# EAGLE design c64-tx (EAGLE 7.7.0)
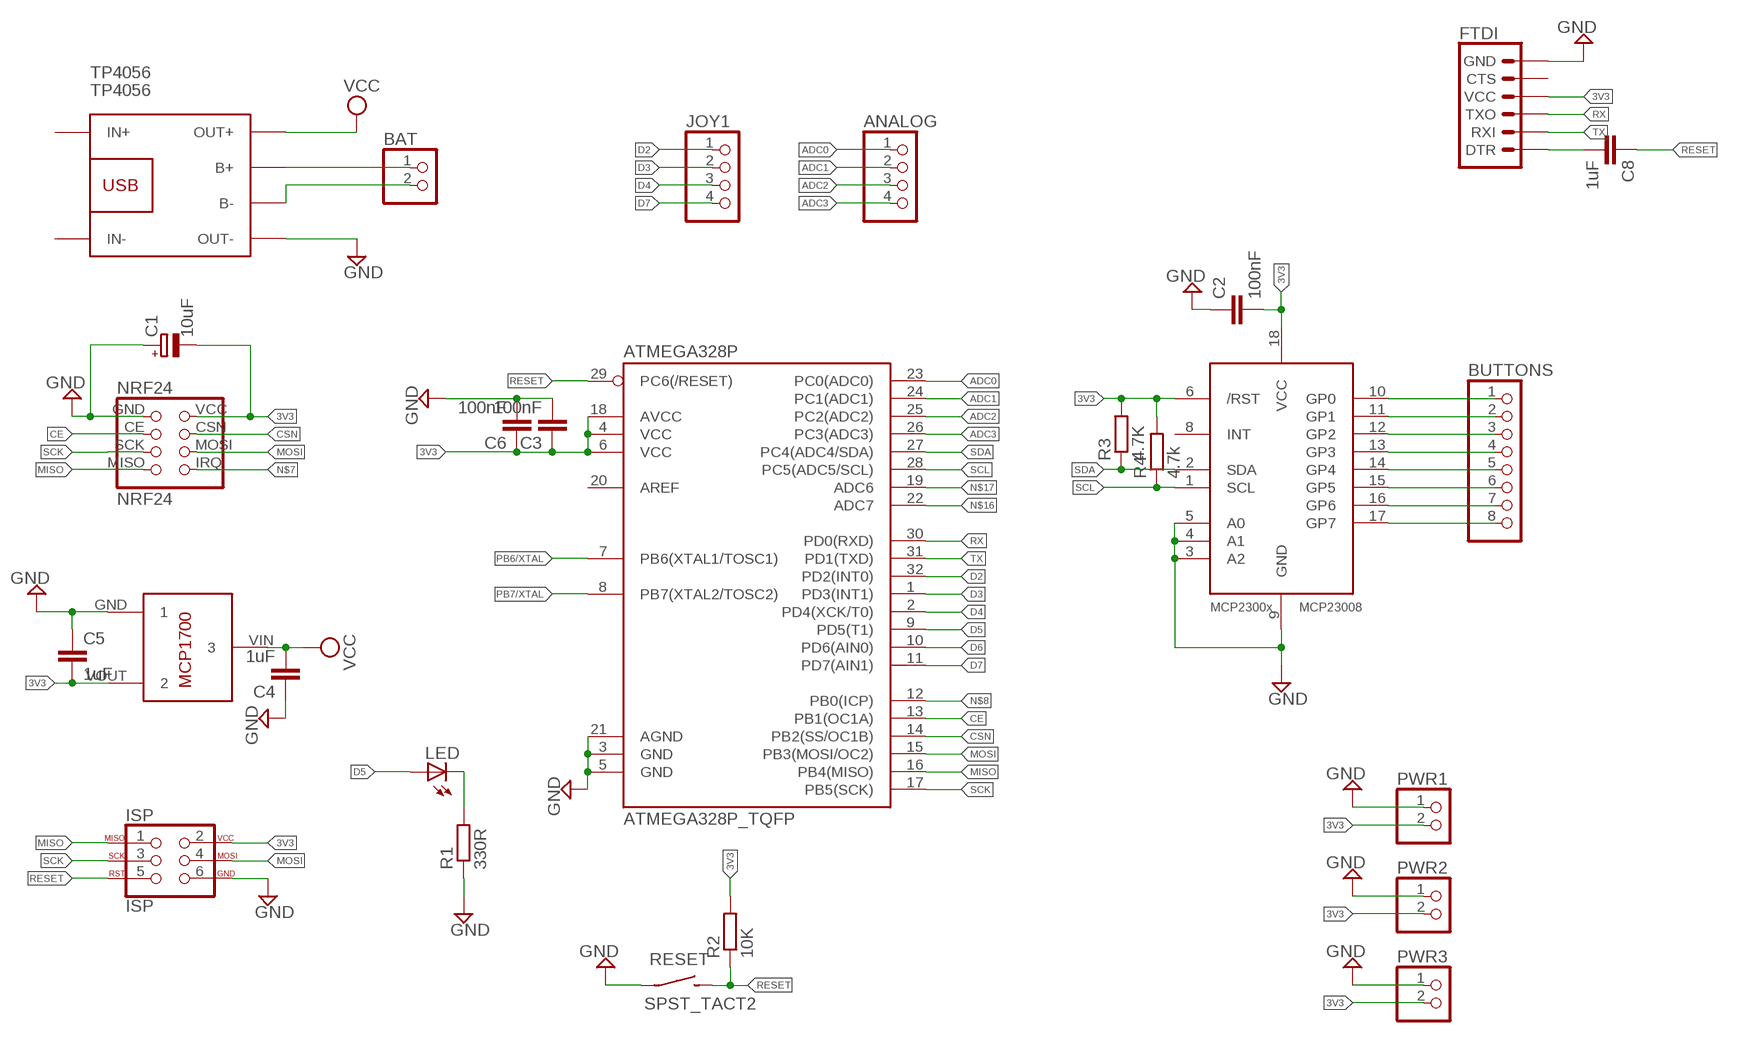
[diagram p0: schematic, sheet 1]

## Parts
ANALOG  PINHD-1X4  [1X04]
ATMEGA328P  ATMEGA328P_TQFP  [TQFP32-08]
BAT  PINHD-1X2  [1X02]
BUTTONS  PINHD-1X8  [1X08]
C1  10uF  CPOL-EUA/3216-18W  [A/3216-18W]
C2  100nF  C-EUC1206K  [C1206K]
C3  100nF  C-EUC1206K  [C1206K]
C4  1uF  C-EUC1206K  [C1206K]
C5  1uF  C-EUC1206K  [C1206K]
C6  100nF  C-EUC1206K  [C1206K]
C8  1uF  C-EUC1206K  [C1206K]
FTDI  6_PIN_SERIAL_TARGETPTH-KIT  [1X06-KIT]
ISP  ISP  AVR_SPI_PROG_3X2NS  [2X3-NS]
JOY1  PINHD-1X4  [1X04]
LED  LEDSMT1206  [1206]
MCP1700  MCP1700T-3302E/TT  [MCP1700T-3302E/TT]
MCP23008  MCP23008/SO  [SO18W]
NRF24  NRF24  NRF24PCBPAD  [NRF24-PCB]
PWR1  PINHD-1X2  [1X02]
PWR2  PINHD-1X2  [1X02]
PWR3  PINHD-1X2  [1X02]
R1  330R  R-EU_M1206  [M1206]
R2  10K  R-EU_M1206  [M1206]
R3  4.7K  R-EU_M1206  [M1206]
R4  4.7k  R-EU_M1206  [M1206]
RESET  SPST_TACT2  [6MMTACTILE]
TP4056  TP4056  BATTERY-CHARGER-LI-PROT  [BATTERY-CHARGER-LI-PROT]

## Nets
3V3 [POWER]: ATMEGA328P.4(VCC) ATMEGA328P.6(VCC) ATMEGA328P.18(AVCC) C1.- C2.2 C3.1 C5.2 C6.1 FTDI.4(VCC) ISP.2 MCP1700.VOUT MCP23008.6(/RST) MCP23008.18(VCC) NRF24.VCC PWR1.2 PWR2.2 PWR3.2 R2.2 R3.2 R4.2
ADC0: ANALOG.1 ATMEGA328P.23(PC0(ADC0))
ADC1: ANALOG.2 ATMEGA328P.24(PC1(ADC1))
ADC2: ANALOG.3 ATMEGA328P.25(PC2(ADC2))
ADC3 [POWER]: ANALOG.4 ATMEGA328P.26(PC3(ADC3))
B+: BAT.1 TP4056.B+
B-: BAT.2 TP4056.B-
CE: ATMEGA328P.13(PB1(OC1A)) NRF24.CE
CSN: ATMEGA328P.14(PB2(SS/OC1B)) NRF24.CSN
D2: ATMEGA328P.32(PD2(INT0)) JOY1.1
D3: ATMEGA328P.1(PD3(INT1)) JOY1.2
D4: ATMEGA328P.2(PD4(XCK/T0)) JOY1.3
D5: ATMEGA328P.9(PD5(T1)) LED.A
D6: ATMEGA328P.10(PD6(AIN0))
D7: ATMEGA328P.11(PD7(AIN1)) JOY1.4
GND: ATMEGA328P.3(GND) ATMEGA328P.5(GND) ATMEGA328P.21(AGND) C1.+ C2.1 C3.2 C4.1 C5.1 C6.2 FTDI.6(GND) ISP.6 MCP1700.GND MCP23008.3(A2) MCP23008.4(A1) MCP23008.5(A0) MCP23008.9(GND) NRF24.GND PWR1.1 PWR2.1 PWR3.1 R1.1 RESET.P$1(P) TP4056.OUT-
MISO: ATMEGA328P.16(PB4(MISO)) ISP.1 NRF24.MISO
MOSI: ATMEGA328P.15(PB3(MOSI/OC2)) ISP.4 NRF24.MOSI
N$1: BUTTONS.1 MCP23008.10(GP0)
N$2: LED.C R1.2
N$6: BUTTONS.2 MCP23008.11(GP1)
N$7: NRF24.IRQ
N$8: ATMEGA328P.12(PB0(ICP))
N$9: BUTTONS.3 MCP23008.12(GP2)
N$10: BUTTONS.4 MCP23008.13(GP3)
N$11: BUTTONS.5 MCP23008.14(GP4)
N$12: BUTTONS.6 MCP23008.15(GP5)
N$13: BUTTONS.7 MCP23008.16(GP6)
N$14: BUTTONS.8 MCP23008.17(GP7)
N$16: ATMEGA328P.22(ADC7)
N$17: ATMEGA328P.19(ADC6)
N$20: C8.2 FTDI.1(DTR)
PB6/XTAL: ATMEGA328P.7(PB6(XTAL1/TOSC1))
PB7/XTAL: ATMEGA328P.8(PB7(XTAL2/TOSC2))
RESET: ATMEGA328P.29(PC6(/RESET)) C8.1 ISP.5 R2.1 RESET.P$2(S)
RX: ATMEGA328P.30(PD0(RXD)) FTDI.3(TXO)
SCK: ATMEGA328P.17(PB5(SCK)) ISP.3 NRF24.SCK
SCL: ATMEGA328P.28(PC5(ADC5/SCL)) MCP23008.1(SCL) R4.1
SDA: ATMEGA328P.27(PC4(ADC4/SDA)) MCP23008.2(SDA) R3.1
TX: ATMEGA328P.31(PD1(TXD)) FTDI.2(RXI)
VCC: C4.2 MCP1700.VIN TP4056.OUT+
Unconnected: ATMEGA328P.20(AREF) FTDI.5(CTS) MCP23008.8(INT) TP4056.IN+ TP4056.IN-

## Library data of the parts
ANALOG JOY1 = pinhead:PINHD-1X4: PIN HEADER
ATMEGA328P = SparkFun-DigitalIC:ATMEGA328P_TQFP; PROD_ID: IC-09069
BAT PWR1-PWR3 = pinhead:PINHD-1X2: PIN HEADER
BUTTONS = pinhead:PINHD-1X8: PIN HEADER
C1 = rcl:CPOL-EU: POLARIZED CAPACITOR, European symbol
C2-C4 C6 C8 = resistor:C-EU: CAPACITOR, European symbol
C5 = rcl:C-EU: CAPACITOR, European symbol
FTDI = SparkFun-Connectors:6_PIN_SERIAL_TARGET: 6-pin header connection for use with the "FTDI BASIC" pinout - TARGET SIDE. Also known as "Arduino Serial Program Header". It is used to mate with our FTDI Basic serial programmers using the Arduino IDE. Note, this device has "TARGET" in the name. It is intended to be used on a design that contains a target micro-controller that you wish to program. The "sister" device, named "CABLE" is inteneded to be used on a design that usually lives on the end of your USB cable and prvides the converter chip (FTDI232 or FTDI231x) to commnicate serial RX/TX. You can populate with some of these: Break Away Headers - Straight <https://www.sparkfun.com/products/116> (PRT-00116) For reference (or to suit your programming needs) check out these designs: SparkFun FTDI Basic Breakout - 5V <https://www.sparkfun.com/products/9716> (DEV-09716) SparkFun FTDI Basic Breakout - 3.3V <https://www.sparkfun.com/products/9873> (DEV-09873) SparkFun FTDI SmartBasic <https://www.sparkfun.com/products/12935> (DEV-12935) SparkFun Beefy 3 - FTDI Basic Breakout <https://www.sparkfun.com/products/13746> (DEV-13746)
ISP = SparkFun-Connectors:AVR_SPI_PROG_3X2: AVR ISP 6 Pin This is the reduced ISP connector for AVR programming. Common on Arduino. This footprint will take up less PCB space and can be used with a 10-pin to 6-pin adapter such as SKU: BOB-08508 **Special note about "TEST_POINT" package. The stop mask is on the top side, so if you want your programming test points to be on the bottom of your board, make sure to place this package on the bottom side of the board. This also ensure that the orientation to program from the bottom side will be correct. SparkFun Products: SparkFun ISP Pogo Adapter <https://www.sparkfun.com/products/11591> - NS Tiny AVR Programmer <https://www.sparkfun.com/products/11801> -PTH
LED = led:LED: LED OSRAM: - CHIPLED LG R971, LG N971, LY N971, LG Q971, LY Q971, LO R971, LY R971 LH N974, LH R974 LS Q976, LO Q976, LY Q976 LO Q996 - Hyper CHIPLED LW Q18S LB Q993, LB Q99A, LB R99A - SideLED LS A670, LO A670, LY A670, LG A670, LP A670 LB A673, LV A673, LT A673, LW A673 LH A674 LY A675 LS A676, LA A676, LO A676, LY A676, LW A676 LS A679, LY A679, LG A679 - Hyper Micro SIDELED® LS Y876, LA Y876, LO Y876, LY Y876 LT Y87S - SmartLED LW L88C, LW L88S LB L89C, LB L89S, LG L890 LS L89K, LO L89K, LY L89K LS L896, LA L896, LO L896, LY L896 - TOPLED LS T670, LO T670, LY T670, LG T670, LP T670 LSG T670, LSP T670, LSY T670, LOP T670, LYG T670 LG T671, LOG T671, LSG T671 LB T673, LV T673, LT T673, LW T673 LH T674 LS T676, LA T676, LO T676, LY T676, LB T676, LH T676, LSB T676, LW T676 LB T67C, LV T67C, LT T67C, LS T67K, LO T67K, LY T67K, LW E67C LS E67B, LA E67B, LO E67B, LY E67B, LB E67C, LV E67C, LT E67C LW T67C LS T679, LY T679, LG T679 LS T770, LO T770, LY T770, LG T770, LP T770 LB T773, LV T773, LT T773, LW T773 LH T774 LS E675, LA E675, LY E675, LS T675 LS T776, LA T776, LO T776, LY T776, LB T776 LHGB T686 LT T68C, LB T68C - Hyper Mini TOPLED® LB M676 - Mini TOPLED Santana® LG M470 LS M47K, LO M47K, LY M47K Source: http://www.osram.convergy.de LUXEON: - LUMILED® LXK2-PW12-R00, LXK2-PW12-S00, LXK2-PW14-U00, LXK2-PW14-V00 LXK2-PM12-R00, LXK2-PM12-S00, LXK2-PM14-U00 LXK2-PE12-Q00, LXK2-PE12-R00, LXK2-PE12-S00, LXK2-PE14-T00, LXK2-PE14-U00 LXK2-PB12-K00, LXK2-PB12-L00, LXK2-PB12-M00, LXK2-PB14-N00, LXK2-PB14-P00, LXK2-PB14-Q00 LXK2-PR12-L00, LXK2-PR12-M00, LXK2-PR14-Q00, LXK2-PR14-R00 LXK2-PD12-Q00, LXK2-PD12-R00, LXK2-PD12-S00 LXK2-PH12-R00, LXK2-PH12-S00 LXK2-PL12-P00, LXK2-PL12-Q00, LXK2-PL12-R00 Source: www.luxeon.com KINGBRIGHT: KA-3528ASYC Source: www.kingbright.com
MCP1700 = MCP1700T-3302E_TT:MCP1700T-3302E/TT: Microchip LDO "MCP1700" in a 3-Pin SOT-23 package. ID: MCP1700T-3302E/TT
MCP23008 = adafruit:MCP23008: MCP23008 Inexpensive i2c i/o expander - 8 general purpose i/o pins with optional pullups
NRF24 = mine:NRF24
R1-R4 = rcl:R-EU_: RESISTOR, European symbol
RESET = bt_electromech:SPST: SPST SWITCH
TP4056 = diy-modules:BATTERY-CHARGER-LI-PROT: Lithium Battery 5V Charger with protection circuit More details available here: http://www.instructables.com/id/DIY-Lithium-ion-Battery-Charger/step4/TP4056-based-lithium-ion-battery-charger-module/ Click here to find device on ebay.com <http://www.ebay.com/sch/tp4056+charger+usb+protection>

## Net classes
1 POWER: width 0.254 mm

## Board
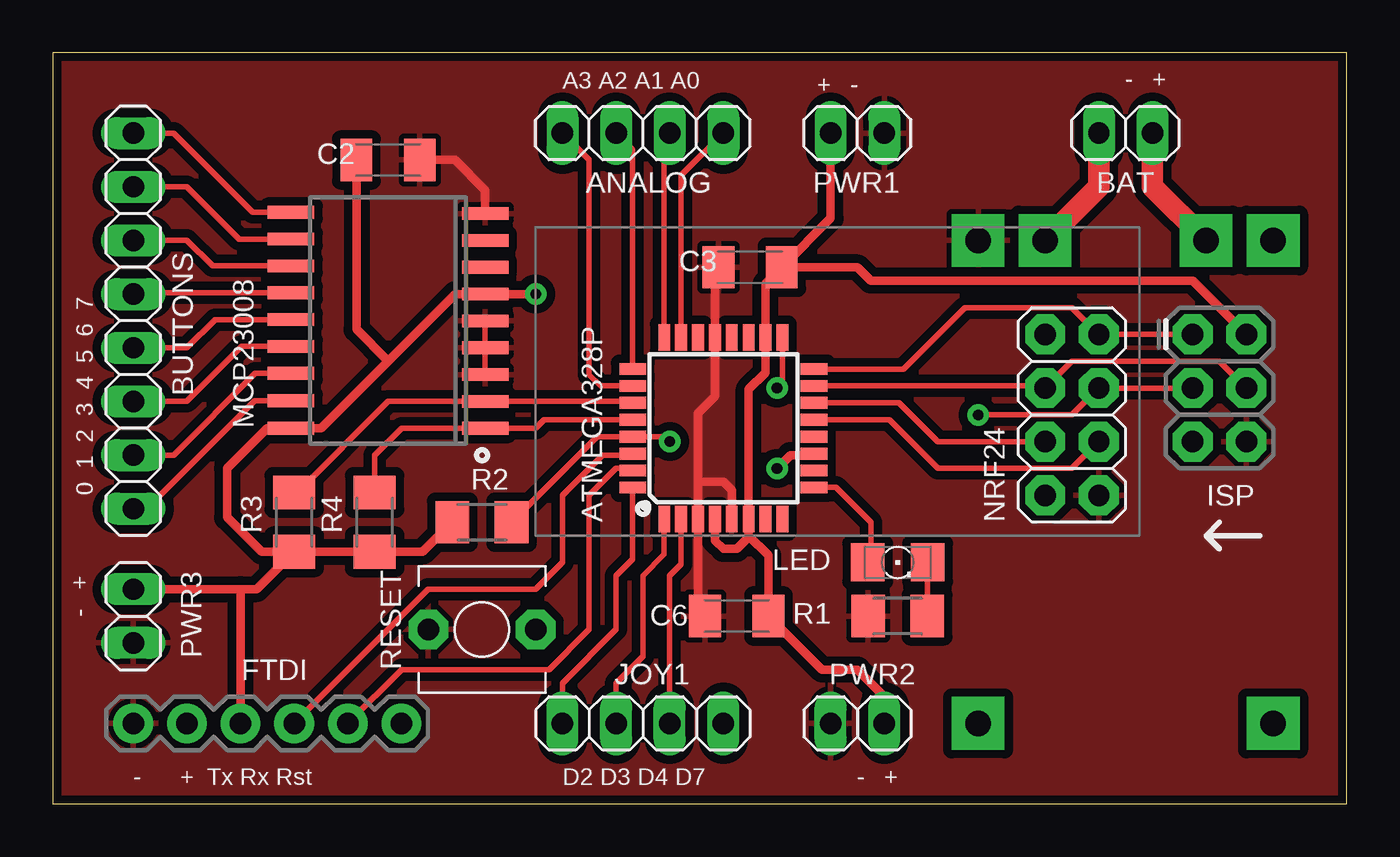
[diagram p1: board, top side]
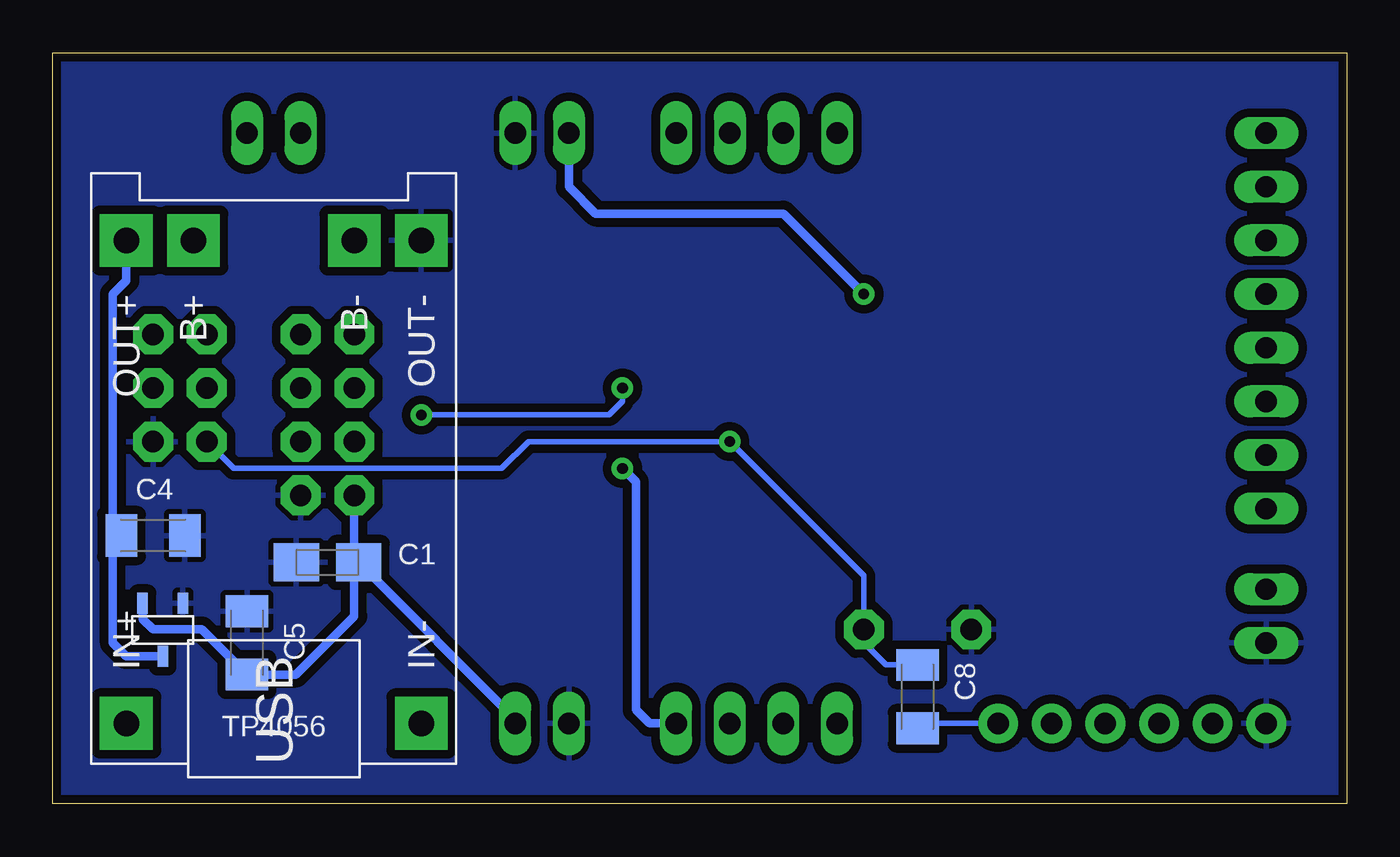
[diagram p2: board, bottom side, seen from below]

Size 61.27 x 35.55 mm. Coordinates in mm from the lower left corner, seen from the top.
Outline: 0,0 61.27,0 61.27,35.55 0,35.55 0,0
Copper layers (1*16): Top 0.035mm / dielectric 1.5mm / Bottom 0.035mm
Design rules "dirt_cheap_dirty_boards.v1": minimum track width 5mil, minimum drill 12mil, track to track 5mil, track to pad 5mil, pad to pad 5mil, via to via 5mil, smd to smd 0mil, copper to edge 10mil, drill to drill 10mil, minimum pad ring 10mil, minimum via ring 6mil, stop-mask expansion 2mil, vias tented up to drill 25mil, thermal gap 10mil

### Footprints (pad centres in the part's own frame; a part is rotated, then mirrored left to right if it is on the bottom)
1X04 = drill 1.016 long: 1 -3.81,0; 2 -1.27,0; 3 1.27,0; 4 3.81,0
TQFP32-08 = smd 1.27 x 0.559: 1 -4.293,2.8; 2 -4.293,2; 3 -4.293,1.2; 4 -4.293,0.4; 5 -4.293,-0.4; 6 -4.293,-1.2; 7 -4.293,-2; 8 -4.293,-2.8; 17 4.293,-2.8; 18 4.293,-2; 19 4.293,-1.2; 20 4.293,-0.4; 21 4.293,0.4; 22 4.293,1.2; 23 4.293,2; 24 4.293,2.8 | smd 0.559 x 1.27: 9 -2.8,-4.293; 10 -2,-4.293; 11 -1.2,-4.293; 12 -0.4,-4.293; 13 0.4,-4.293; 14 1.2,-4.293; 15 2,-4.293; 16 2.8,-4.293; 25 2.8,4.293; 26 2,4.293; 27 1.2,4.293; 28 0.4,4.293; 29 -0.4,4.293; 30 -1.2,4.293; 31 -2,4.293; 32 -2.8,4.293
1X02 = drill 1.016 long: 1 -1.27,0; 2 1.27,0
1X08 = drill 1.016 long: 1 -8.89,0; 2 -6.35,0; 3 -3.81,0; 4 -1.27,0; 5 1.27,0; 6 3.81,0; 7 6.35,0; 8 8.89,0
A/3216-18W = smd 2.15 x 1.8: + 1.475,0; - -1.475,0
C1206K = smd 1.5 x 2: 1 -1.5,0; 2 1.5,0
1X06-KIT = drill 1.016 pad 1.88: 1 0,0; 2 2.54,0; 3 5.08,0; 4 7.62,0; 5 10.16,0; 6 12.7,0
2X3-NS = drill 1.016 pad 1.88 octagon: 1 -2.54,-1.27; 2 -2.54,1.27; 3 0,-1.27; 4 0,1.27; 5 2.54,-1.27; 6 2.54,1.27
1206 = smd 1.6 x 1.803: A -1.422,0; C 1.422,0
MCP1700T-3302E/TT = smd 0.5 x 1: GND 0.5,-0.6; VIN 1.45,1.9; VOUT 2.4,-0.6
SO18W = smd 0.6 x 2.2: 1 -4.445,-4.6; 2 -3.175,-4.6; 3 -1.905,-4.6; 4 -0.635,-4.6; 5 0.635,-4.6; 6 1.905,-4.6; 7 3.175,-4.6; 8 4.445,-4.6; 9 5.715,-4.6; 10 5.775,4.6; 11 4.505,4.6; 12 3.235,4.6; 13 1.965,4.6; 14 0.695,4.6; 15 -0.575,4.6; 16 -1.845,4.6; 17 -3.145,4.6; 18 -4.445,4.6
NRF24-PCB = drill 1.016 pad 1.88 octagon: CE 3.81,-1.27; CSN 3.81,1.27; GND 1.27,-1.27; IRQ 8.89,1.27; MISO 8.89,-1.27; MOSI 6.35,1.27; SCK 6.35,-1.27; VCC 1.27,1.27
M1206 = smd 1.6 x 2: 1 -1.4,0; 2 1.4,0
6MMTACTILE = drill 1.016 pad 1.88 octagon: P$1 -2.54,0; P$2 2.54,0
BATTERY-CHARGER-LI-PROT = drill 1.2 pad 2.5 square: B+ 10.795,3.81; B- 10.795,-3.81; IN+ -12.065,6.985; IN- -12.065,-6.985; OUT+ 10.795,6.985; OUT- 10.795,-6.985

### Placement (x,y rotation side)
ANALOG  27.94,31.75 180 top
ATMEGA328P  31.75,17.78 90 top
BAT  50.8,31.75 180 top
BUTTONS  3.81,22.86 270 top
C1  48.26,11.43 180 bottom
C2  15.88,30.48 180 top
C3  33.02,25.4 180 top
C4  56.52,12.7 180 bottom
C5  52.07,7.62 270 bottom
C6  32.38,8.89 180 top
C8  20.32,5.08 270 bottom
FTDI  16.51,3.81 180 top
ISP  55.24,19.68 270 top
JOY1  27.94,3.81 0 top
LED  40.01,11.43 0 top
MCP1700  54.61,8.89 180 bottom
MCP23008  15.88,22.23 90 top
NRF24  48.26,13.34 90 top
PWR1  38.1,31.75 180 top
PWR2  38.1,3.81 0 top
PWR3  3.81,8.89 90 top
R1  40.01,8.89 0 top
R2  20.32,13.34 180 top
R3  11.43,13.34 270 top
R4  15.24,13.34 270 top
RESET  20.32,8.26 0 top
TP4056  50.8,15.88 90 bottom

### Tracks (layer width: path | path; a pad name or v marks a point on that pad's centre or on a via)
3V3  (via drill 0.5 pad 1.02)
  Top 0.406: PWR1.2 36.83,27.71 C3.1 | ISP.2 53.98,24.77 38.73,24.77 38.1,25.4 C3.1 | C3.1 33.75,24.63 ATMEGA328P.18 33.75,20.41 32.95,19.61 ATMEGA328P.6 32.95,12.7 | 15.88,20.95 19.05,24.13 MCP23008.6 v22.86,24.13 | 15.88,20.95 12.7,17.78 MCP23008.18 10.16,17.78 8.26,15.88 8.26,13.56 9.88,11.94 R3.2 | R3.2 R4.2 17.52,11.94 R2.2 | C2.2 14.38,22.45 15.88,20.95 | PWR3.2 8.89,10.16 | 8.89,10.16 9.65,10.16 R3.2 | FTDI.4 8.89,10.16 | ATMEGA328P.4 31.35,12.46 31.75,12.06 32.38,12.06 32.95,12.63 32.95,12.7 | 32.95,12.7 33.88,11.77 C6.1 36.42,6.35 38.1,6.35 39.37,5.08 PWR2.2
  Bottom 0.406: MCP1700.VOUT 57.01,8.75 56.52,8.26 54.2,8.26 C5.2 49.76,6.12 46.99,8.89 46.99,11.22 C1.- | NRF24.VCC 46.99,11.63 C1.- | PWR1.2 36.83,29.21 35.56,27.94 26.67,27.94 v22.86,24.13 | PWR2.2 39.37,4.01 C1.-
ADC0
  Top 0.254: ATMEGA328P.23 29.75,29.75 ANALOG.1
ADC1
  Top 0.254: ATMEGA328P.24 28.95,31.49 ANALOG.2
ADC2
  Top 0.254: ATMEGA328P.25 27.46,30.96 ANALOG.3
ADC3
  Top 0.254: ATMEGA328P.26 25.94,19.78 25.4,20.32 25.4,30.48 ANALOG.4
B+
  Top 1.016: BAT.1 52.07,29.21 TP4056.B+
B-
  Top 1.016: BAT.2 49.53,29.21 TP4056.B-
CE
  Top 0.254: ATMEGA328P.13 39.6,18.18 41.91,15.88 48.26,15.88 NRF24.CE
CSN
  Top 0.254: ATMEGA328P.14 40.08,18.98 41.91,17.14 NRF24.CSN
D2
  Top 0.254: ATMEGA328P.32 27.46,11.58 26.67,10.79 26.67,8.26 24.13,5.71 JOY1.1
D3
  Top 0.254: ATMEGA328P.1 28.95,11.8 27.94,10.79 27.94,6.99 26.67,5.71 JOY1.2
D4
  Top 0.254: ATMEGA328P.2 29.75,11.34 29.21,10.79 JOY1.3
D5
  Top 0.254: ATMEGA328P.9 37.09,14.98 38.73,13.34 38.73,11.58 LED.A
D7  (via drill 0.5 pad 1.02)
  Top 0.406: ATMEGA328P.11 35.97,16.51 34.92,16.51 v34.29,15.88
  Bottom 0.406: JOY1.4 33.02,3.81 33.66,4.45 33.66,15.24 v34.29,15.88
GND
  Top 0.254: MCP23008.3 MCP23008.4 MCP23008.5
  Top 0.406: C3.2 31.35,25.23 ATMEGA328P.21 31.35,19.29 30.55,18.48 30.55,15.24 | MCP23008.9 20.48,29.05 19.05,30.48 C2.1 | C6.2 30.55,9.22 ATMEGA328P.3 30.55,15.24 | ATMEGA328P.5 32.15,14.84 31.75,15.24 30.55,15.24
  pour Bottom (isolate 0.406): 0,0 0,35.56 60.96,35.56 60.96,0
  pour Top (isolate 0.406): 0,35.56 60.96,35.56 60.96,0 0,0
MISO
  Top 0.254: ATMEGA328P.16 40.27,20.58 43.18,23.5 48.26,23.5 NRF24.MISO ISP.1
MOSI
  Top 0.254: ATMEGA328P.15 46.9,19.78 NRF24.MOSI 48.26,20.95 55.24,20.95 ISP.4
N$1
  Top 0.254: MCP23008.10 9.46,28 5.71,31.75 BUTTONS.1
N$2
  Top 0.254: R1.2 41.41,11.41 LED.C
N$6
  Top 0.254: MCP23008.11 8.83,26.73 6.35,29.21 BUTTONS.2
N$9
  Top 0.254: MCP23008.12 7.56,25.46 6.35,26.67 BUTTONS.3
N$10
  Top 0.254: MCP23008.13 3.87,24.19 BUTTONS.4
N$11
  Top 0.254: MCP23008.14 7.68,22.92 6.35,21.59 BUTTONS.5
N$12
  Top 0.254: MCP23008.15 8.95,21.65 6.35,19.05 BUTTONS.6
N$13
  Top 0.254: MCP23008.16 9.59,20.38 5.71,16.51 BUTTONS.7
N$14
  Top 0.254: MCP23008.17 9.55,19.08 4.45,13.97 BUTTONS.8
N$20
  Bottom 0.254: FTDI.1 20.09,3.81 C8.2
RESET  (via drill 0.5 pad 1.02)
  Top 0.254: v29.21,17.14 28.98,17.38 ATMEGA328P.29 25.77,17.38 R2.1
  Bottom 0.254: ISP.5 52.7,15.88 40.01,15.88 38.73,17.14 v29.21,17.14 22.86,10.79 RESET.P$2 22.86,7.62 21.82,6.58 C8.1
RX
  Top 0.254: FTDI.3 17.78,10.16 22.86,10.16 24.13,11.43 24.13,14.61 26.04,16.51 27.39,16.51 ATMEGA328P.30
SCK  (via drill 0.5 pad 1.02)
  Top 0.254: v43.81,18.41 48.26,18.41 NRF24.SCK ISP.3 | ATMEGA328P.17 34.55,19.95 v34.29,19.68
  Bottom 0.254: v43.81,18.41 34.92,18.41 34.29,19.05 v34.29,19.68
SCL
  Top 0.254: ATMEGA328P.28 23.26,18.18 22.86,17.78 MCP23008.1 16.51,17.78 15.24,16.51 R4.1
SDA
  Top 0.254: ATMEGA328P.27 27.39,19.05 MCP23008.2 15.88,19.05 11.56,14.73 R3.1
TX
  Top 0.254: FTDI.2 16.51,6.35 23.5,6.35 25.4,8.26 25.4,14.61 26.67,15.88 27.36,15.88 ATMEGA328P.31
VCC
  Bottom 0.406: TP4056.OUT+ 57.78,24.77 58.42,24.13 58.42,13.11 | MCP1700.VIN 57.79,6.99 58.42,7.62 58.42,12.29
  Bottom 0.61: C4.2 58.42,12.7 | C4.2 57.78,12.7 | 58.42,13.11 C4.2 | 58.42,12.29 C4.2

### Text on the board
tNames: A3 A2 A1 A0 | + - | - + | 0 1 2 3 4 5 6 7 | - + | - + Tx Rx Rst | D2 D3 D4 D7 | - +